# Altium schematic sheet Connector-Sheet.SchDoc
size 420 x 297 mm; SheetNumber: 8; SheetTotal: 8
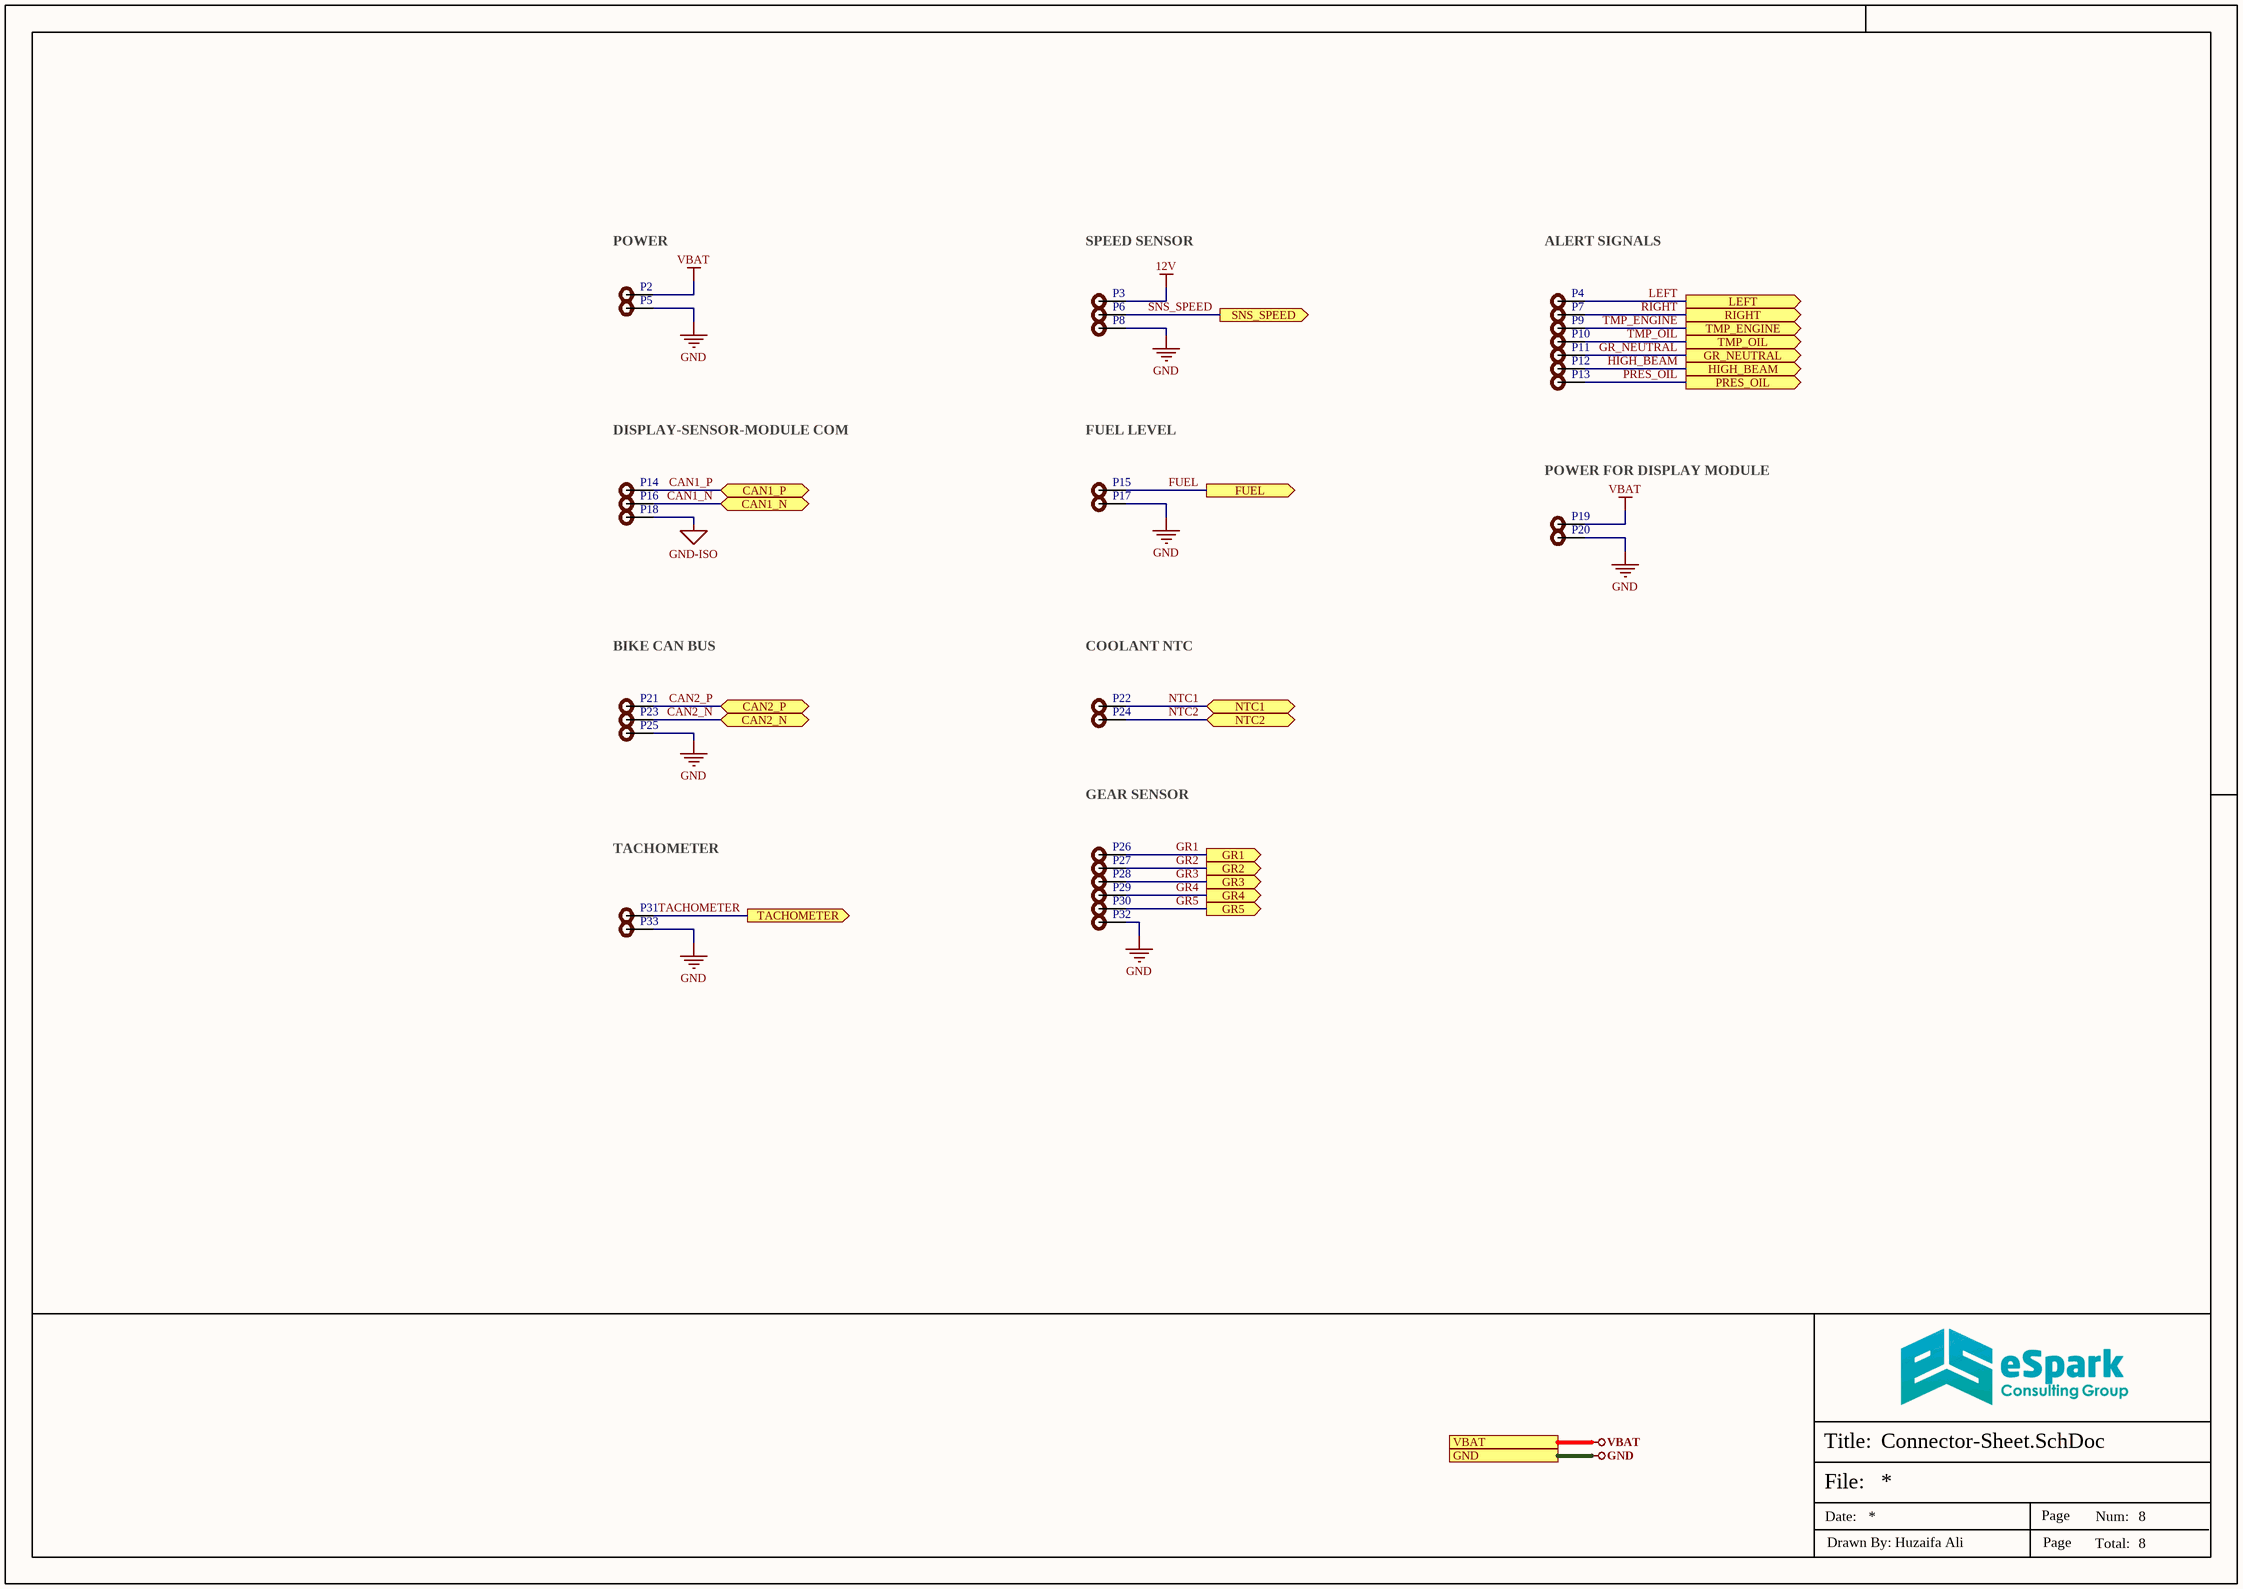
[diagram p0: Connector-Sheet.SchDoc]

## Parts
P2  0.5mm Test Pad  [0.5mm Test Pad]  (value not drawn)  (no BOM)
P3  0.5mm Test Pad  [0.5mm Test Pad]  (value not drawn)  (no BOM)
P4  0.5mm Test Pad  [0.5mm Test Pad]  (value not drawn)  (no BOM)
P5  0.5mm Test Pad  [0.5mm Test Pad]  (value not drawn)  (no BOM)
P6  0.5mm Test Pad  [0.5mm Test Pad]  (value not drawn)  (no BOM)
P7  0.5mm Test Pad  [0.5mm Test Pad]  (value not drawn)  (no BOM)
P8  0.5mm Test Pad  [0.5mm Test Pad]  (value not drawn)  (no BOM)
P9  0.5mm Test Pad  [0.5mm Test Pad]  (value not drawn)  (no BOM)
P10  0.5mm Test Pad  [0.5mm Test Pad]  (value not drawn)  (no BOM)
P11  0.5mm Test Pad  [0.5mm Test Pad]  (value not drawn)  (no BOM)
P12  0.5mm Test Pad  [0.5mm Test Pad]  (value not drawn)  (no BOM)
P13  0.5mm Test Pad  [0.5mm Test Pad]  (value not drawn)  (no BOM)
P14  0.5mm Test Pad  [0.5mm Test Pad]  (value not drawn)  (no BOM)
P15  0.5mm Test Pad  [0.5mm Test Pad]  (value not drawn)  (no BOM)
P16  0.5mm Test Pad  [0.5mm Test Pad]  (value not drawn)  (no BOM)
P17  0.5mm Test Pad  [0.5mm Test Pad]  (value not drawn)  (no BOM)
P18  0.5mm Test Pad  [0.5mm Test Pad]  (value not drawn)  (no BOM)
P19  0.5mm Test Pad  [0.5mm Test Pad]  (value not drawn)  (no BOM)
P20  0.5mm Test Pad  [0.5mm Test Pad]  (value not drawn)  (no BOM)
P21  0.5mm Test Pad  [0.5mm Test Pad]  (value not drawn)  (no BOM)
P22  0.5mm Test Pad  [0.5mm Test Pad]  (value not drawn)  (no BOM)
P23  0.5mm Test Pad  [0.5mm Test Pad]  (value not drawn)  (no BOM)
P24  0.5mm Test Pad  [0.5mm Test Pad]  (value not drawn)  (no BOM)
P25  0.5mm Test Pad  [0.5mm Test Pad]  (value not drawn)  (no BOM)
P26  0.5mm Test Pad  [0.5mm Test Pad]  (value not drawn)  (no BOM)
P27  0.5mm Test Pad  [0.5mm Test Pad]  (value not drawn)  (no BOM)
P28  0.5mm Test Pad  [0.5mm Test Pad]  (value not drawn)  (no BOM)
P29  0.5mm Test Pad  [0.5mm Test Pad]  (value not drawn)  (no BOM)
P30  0.5mm Test Pad  [0.5mm Test Pad]  (value not drawn)  (no BOM)
P31  0.5mm Test Pad  [0.5mm Test Pad]  (value not drawn)  (no BOM)
P32  0.5mm Test Pad  [0.5mm Test Pad]  (value not drawn)  (no BOM)
P33  0.5mm Test Pad  [0.5mm Test Pad]  (value not drawn)  (no BOM)

## Ports
CAN1_N (bidir, see Top-Sheet[5B], CAN-Sheet[5B]), CAN1_P (bidir, see Top-Sheet[5B], CAN-Sheet[5A]), CAN2_N (bidir, see Top-Sheet[5B], CAN-Sheet[5C]), CAN2_P (bidir, see Top-Sheet[5B], CAN-Sheet[5C]), FUEL (out, see Top-Sheet[5C]), GND (see Top-Sheet[5B], Power-Sheet[4D], Sensors-Sheet[1D]), GR1 (out, see Top-Sheet[5C]), GR2 (out, see Top-Sheet[5C]), GR3 (out, see Top-Sheet[5C]), GR4 (out, see Top-Sheet[5C]), GR5 (out, see Top-Sheet[5C]), GR_NEUTRAL (out, see Top-Sheet[5C]), HIGH_BEAM (out, see Top-Sheet[5C]), LEFT (out, see Top-Sheet[5C]), NTC1 (bidir, see Top-Sheet[5C]), NTC2 (bidir, see Top-Sheet[5C]), PRES_OIL (out, see Top-Sheet[5C]), RIGHT (out, see Top-Sheet[5C]), SNS_SPEED (out, see Top-Sheet[5C]), TACHOMETER (out, see Top-Sheet[5C]), TMP_ENGINE (out, see Top-Sheet[5C]), TMP_OIL (out, see Top-Sheet[5C]), VBAT (see Top-Sheet[5B], Power-Sheet[4D])

## Nets
12V: P3.1
GND: P5.1 P8.1 P17.1 P20.1 P25.1 P32.1 P33.1 ; port GND
GND-ISO: P18.1
VBAT: P2.1 P19.1 ; port VBAT
CAN1_N: P16.1 ; port CAN1_N
CAN1_P: P14.1 ; port CAN1_P
CAN2_N: P23.1 ; port CAN2_N
CAN2_P: P21.1 ; port CAN2_P
FUEL: P15.1 ; port FUEL
GR1: P26.1 ; port GR1
GR2: P27.1 ; port GR2
GR3: P28.1 ; port GR3
GR4: P29.1 ; port GR4
GR5: P30.1 ; port GR5
GR_NEUTRAL: P11.1 ; port GR_NEUTRAL
HIGH_BEAM: P12.1 ; port HIGH_BEAM
LEFT: P4.1 ; port LEFT
NTC1: P22.1 ; port NTC1
NTC2: P24.1 ; port NTC2
PRES_OIL: P13.1 ; port PRES_OIL
RIGHT: P7.1 ; port RIGHT
SNS_SPEED: P6.1 ; port SNS_SPEED
TACHOMETER: P31.1 ; port TACHOMETER
TMP_ENGINE: P9.1 ; port TMP_ENGINE
TMP_OIL: P10.1 ; port TMP_OIL

## Notes on the sheet
- POWER
- SPEED SENSOR
- ALERT SIGNALS
- DISPLAY-SENSOR-MODULE COM
- FUEL LEVEL
- POWER FOR DISPLAY MODULE
- BIKE CAN BUS
- COOLANT NTC
- GEAR SENSOR
- TACHOMETER
- File:
- Title:
- Date:
- Page
- Num:
- Total:
- Drawn By: Huzaifa Ali

## Library data of the parts
P2-P33 = 0.5mm Test Pad: Test pad